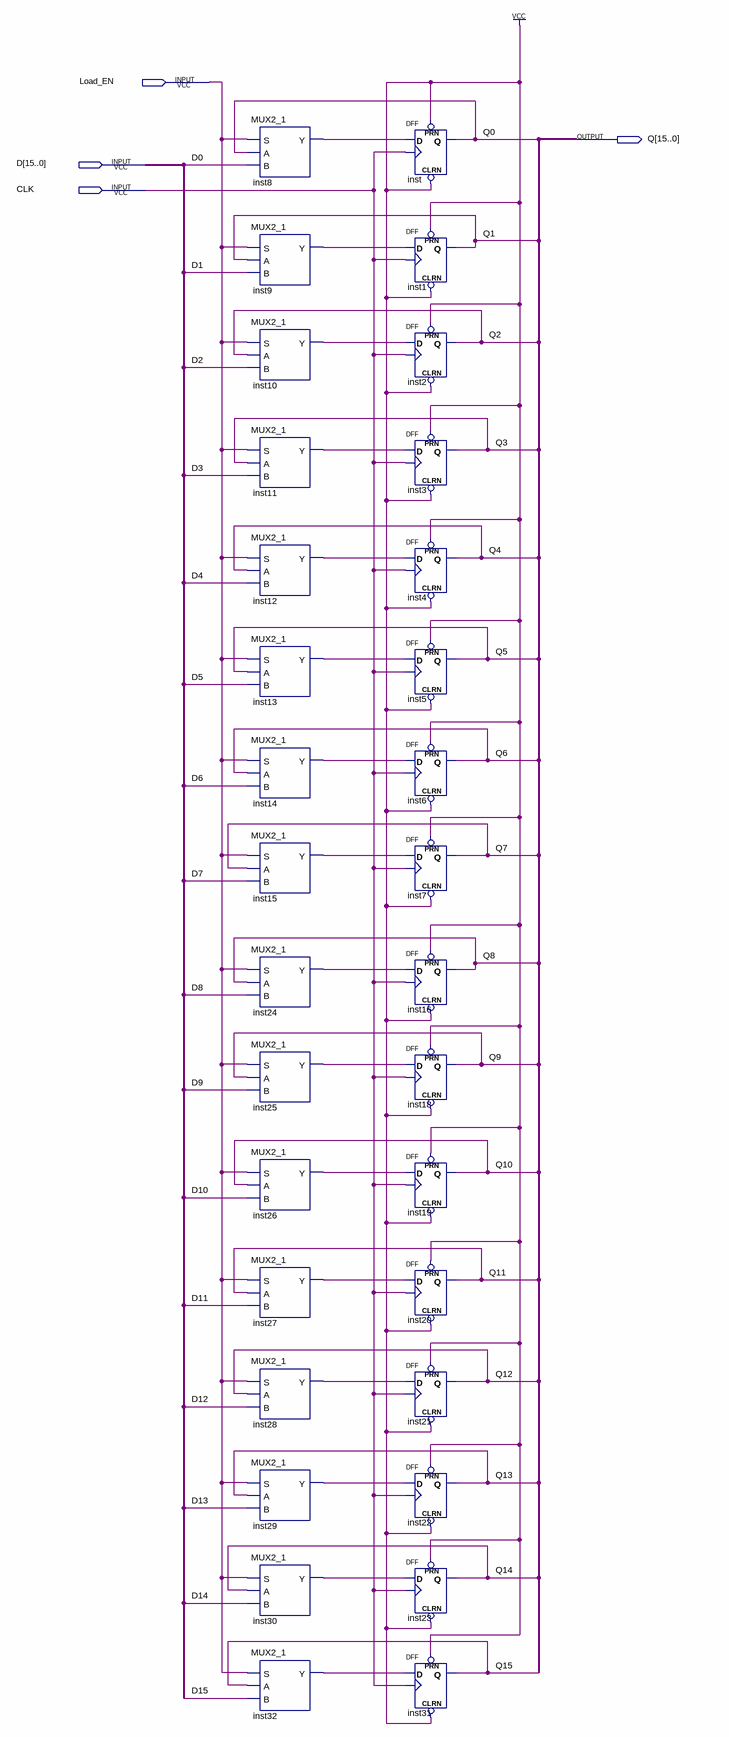
[diagram p0: schematic sheet]
// Quartus schematic register_16_bit.bdf as structural Verilog: 32 symbols, 4 pins
module register_16_bit (
  input  Load_EN,
  input  [15:0] D,
  input  CLK,
  output [15:0] Q
);

  wire inst8_y, inst9_y, inst10_y, inst11_y, inst12_y, inst13_y, inst14_y, inst15_y, inst24_y, inst25_y,
       inst26_y, inst27_y, inst28_y, inst29_y, inst30_y, inst32_y;

  MUX2_1 inst8 (.S(Load_EN), .A(Q[0]), .B(D[0]), .Y(inst8_y));
  MUX2_1 inst9 (.S(Load_EN), .A(Q[1]), .B(D[1]), .Y(inst9_y));
  MUX2_1 inst10 (.S(Load_EN), .A(Q[2]), .B(D[2]), .Y(inst10_y));
  MUX2_1 inst11 (.S(Load_EN), .A(Q[3]), .B(D[3]), .Y(inst11_y));
  MUX2_1 inst12 (.S(Load_EN), .A(Q[4]), .B(D[4]), .Y(inst12_y));
  MUX2_1 inst13 (.S(Load_EN), .A(Q[5]), .B(D[5]), .Y(inst13_y));
  MUX2_1 inst14 (.S(Load_EN), .A(Q[6]), .B(D[6]), .Y(inst14_y));
  MUX2_1 inst15 (.S(Load_EN), .A(Q[7]), .B(D[7]), .Y(inst15_y));
  MUX2_1 inst24 (.S(Load_EN), .A(Q[8]), .B(D[8]), .Y(inst24_y));
  MUX2_1 inst25 (.S(Load_EN), .A(Q[9]), .B(D[9]), .Y(inst25_y));
  MUX2_1 inst26 (.S(Load_EN), .A(Q[10]), .B(D[10]), .Y(inst26_y));
  MUX2_1 inst27 (.S(Load_EN), .A(Q[11]), .B(D[11]), .Y(inst27_y));
  MUX2_1 inst28 (.S(Load_EN), .A(Q[12]), .B(D[12]), .Y(inst28_y));
  MUX2_1 inst29 (.S(Load_EN), .A(Q[13]), .B(D[13]), .Y(inst29_y));
  MUX2_1 inst30 (.S(Load_EN), .A(Q[14]), .B(D[14]), .Y(inst30_y));
  MUX2_1 inst32 (.S(Load_EN), .A(Q[15]), .B(D[15]), .Y(inst32_y));
  DFF inst (.CLRN(1'b1), .CLK(CLK), .D(inst8_y), .PRN(1'b1), .Q(Q[0]));
  DFF inst1 (.CLRN(1'b1), .CLK(CLK), .D(inst9_y), .PRN(1'b1), .Q(Q[1]));
  DFF inst2 (.CLRN(1'b1), .CLK(CLK), .D(inst10_y), .PRN(1'b1), .Q(Q[2]));
  DFF inst3 (.CLRN(1'b1), .CLK(CLK), .D(inst11_y), .PRN(1'b1), .Q(Q[3]));
  DFF inst4 (.CLRN(1'b1), .CLK(CLK), .D(inst12_y), .PRN(1'b1), .Q(Q[4]));
  DFF inst5 (.CLRN(1'b1), .CLK(CLK), .D(inst13_y), .PRN(1'b1), .Q(Q[5]));
  DFF inst6 (.CLRN(1'b1), .CLK(CLK), .D(inst14_y), .PRN(1'b1), .Q(Q[6]));
  DFF inst7 (.CLRN(1'b1), .CLK(CLK), .D(inst15_y), .PRN(1'b1), .Q(Q[7]));
  DFF inst16 (.CLRN(1'b1), .CLK(CLK), .D(inst24_y), .PRN(1'b1), .Q(Q[8]));
  DFF inst18 (.CLRN(1'b1), .CLK(CLK), .D(inst25_y), .PRN(1'b1), .Q(Q[9]));
  DFF inst19 (.CLRN(1'b1), .CLK(CLK), .D(inst26_y), .PRN(1'b1), .Q(Q[10]));
  DFF inst20 (.CLRN(1'b1), .CLK(CLK), .D(inst27_y), .PRN(1'b1), .Q(Q[11]));
  DFF inst21 (.CLRN(1'b1), .CLK(CLK), .D(inst28_y), .PRN(1'b1), .Q(Q[12]));
  DFF inst22 (.CLRN(1'b1), .CLK(CLK), .D(inst29_y), .PRN(1'b1), .Q(Q[13]));
  DFF inst23 (.CLRN(1'b1), .CLK(CLK), .D(inst30_y), .PRN(1'b1), .Q(Q[14]));
  DFF inst31 (.CLRN(1'b1), .CLK(CLK), .D(inst32_y), .PRN(1'b1), .Q(Q[15]));
endmodule
